# Altium schematic sheet POWER_ADC.SchDoc: ADC Supply
size A3; SheetNumber: 8; SheetTotal: 17
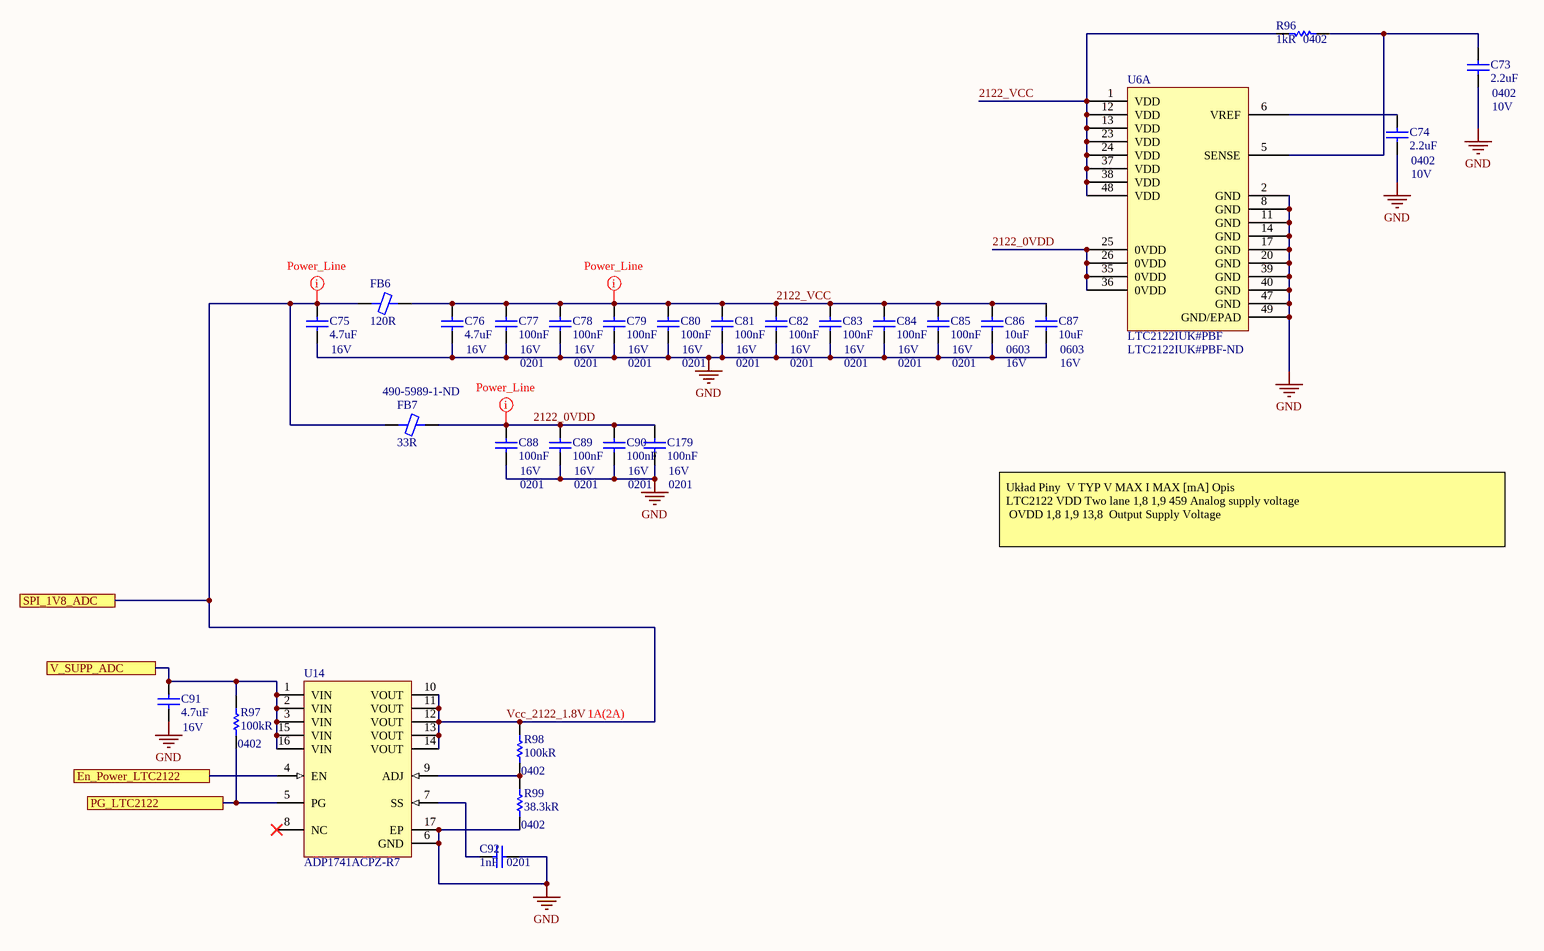
[diagram p0: POWER_ADC.SchDoc]

## Parts
C73  2.2uF  Case Code (Imperial): 0402  Voltage Rating: 10V  [CAP 0402/1005 RF KK]
C74  2.2uF  Case Code (Imperial): 0402  Voltage Rating: 10V  [CAP 0402/1005 RF KK]
C75  4.7uF  Voltage: 16V  [CAP 0603/1608 RF]
C76  4.7uF  Voltage: 16V  [CAP 0603/1608 RF]
C77  100nF  Case/Package: 0201  Voltage Rating: 16V  [CAP 0201/0603 KK]
C78  100nF  Case/Package: 0201  Voltage Rating: 16V  [CAP 0201/0603 KK]
C79  100nF  Case/Package: 0201  Voltage Rating: 16V  [CAP 0201/0603 KK]
C80  100nF  Case/Package: 0201  Voltage Rating: 16V  [CAP 0201/0603 KK]
C81  100nF  Case/Package: 0201  Voltage Rating: 16V  [CAP 0201/0603 KK]
C82  100nF  Case/Package: 0201  Voltage Rating: 16V  [CAP 0201/0603 KK]
C83  100nF  Case/Package: 0201  Voltage Rating: 16V  [CAP 0201/0603 KK]
C84  100nF  Case/Package: 0201  Voltage Rating: 16V  [CAP 0201/0603 KK]
C85  100nF  Case/Package: 0201  Voltage Rating: 16V  [CAP 0201/0603 KK]
C86  10uF  Case/Package: 0603  Voltage Rating: 16V  [CAP 0603/1608 RF]
C87  10uF  Case/Package: 0603  Voltage Rating: 16V  [CAP 0603/1608 RF]
C88  100nF  Case/Package: 0201  Voltage Rating: 16V  [CAP 0201/0603 KK]
C89  100nF  Case/Package: 0201  Voltage Rating: 16V  [CAP 0201/0603 KK]
C90  100nF  Case/Package: 0201  Voltage Rating: 16V  [CAP 0201/0603 KK]
C91  4.7uF  Voltage: 16V  [CAP 0603/1608 RF]
C92  1nF  Case/Package: 0201  [CAP 0201/0603 KK]
C179  100nF  Case/Package: 0201  Voltage Rating: 16V  [CAP 0201/0603 KK]
FB6  120R  [FER 0402/1005 KK]
FB7  33R  Supplier Part Number 1: 490-5989-1-ND  [FB1206]
R96  1kR  Case/Package: 0402  [RES 0402/1005 RF KK]
R97  100kR  Case/Package: 0402  [RES 0402/1005 RF KK]
R98  100kR  Case/Package: 0402  [RES 0402/1005 RF KK]
R99  38.3kR  Case/Package: 0402  [RES 0402/1005 RF KK]
U6  LTC2122IUK#PBF  Supplier Part Number 1: LTC2122IUK#PBF-ND  [LTC2122]  (part A of 2)
U14  ADP1741ACPZ-R7  [ADI-CP-16-13_M]

## Ports
En_Power_LTC2122, PG_LTC2122, SPI_1V8_ADC, V_SUPP_ADC

## Nets
GND: C73.1 C74.1 C75.1 C76.1 C77.1 C78.1 C79.1 C80.1 C81.1 C82.1 C83.1 C84.1 C85.1 C86.1 C87.1 C88.1 C89.1 C90.1 C91.1 C92.2 C179.1 R99.1 U6.2(GND) U6.8(GND) U6.11(GND) U6.14(GND) U6.17(GND) U6.20(GND) U6.39(GND) U6.40(GND) U6.47(GND) U6.49(GND/EPAD) U14.6(GND) U14.17(EP)
2122_0VDD: C88.2 C89.2 C90.2 C179.2 FB7.2 U6.25(0VDD) U6.26(0VDD) U6.35(0VDD) U6.36(0VDD)
2122_VCC: C76.2 C77.2 C78.2 C79.2 C80.2 C81.2 C82.2 C83.2 C84.2 C85.2 C86.2 C87.2 FB6.2 R96.1 U6.1(VDD) U6.12(VDD) U6.13(VDD) U6.23(VDD) U6.24(VDD) U6.37(VDD) U6.38(VDD) U6.48(VDD)
En_Power_LTC2122: U14.4(EN) ; port En_Power_LTC2122
PG_LTC2122: R97.1 U14.5(PG) ; port PG_LTC2122
V_SUPP_ADC: C91.2 R97.2 U14.1(VIN) U14.2(VIN) U14.3(VIN) U14.15(VIN) U14.16(VIN) ; port V_SUPP_ADC
Vcc_2122_1.8V: C75.2 FB6.1 FB7.1 R98.2 U14.10(VOUT) U14.11(VOUT) U14.12(VOUT) U14.13(VOUT) U14.14(VOUT) ; port SPI_1V8_ADC
NetC73_2: C73.2 R96.2 U6.5(SENSE)
NetC74_2: C74.2 U6.6(VREF)
NetC92_1: C92.1 U14.7(SS)
NetR98_1: R98.1 R99.2 U14.9(ADJ)

Not connected (* = marked no-connect by the designer): U14 8(NC)*

## Layout directives
net class Power_Line: 2122_0VDD, 2122_VCC, Vcc_2122_1.8V

## Notes on the sheet
- Układ	Piny 	V TYP	V MAX	I MAX [mA]	Opis
  LTC2122	VDD Two lane	1,8	1,9	459	Analog supply voltage
  OVDD	1,8	1,9	13,8		Output Supply Voltage
- 1A(2A)
- Title
- Size:
- Date:
- A3
- Number:
- Time:
- Revision:
- Sheet
- of
- File:

## Library data of the parts
C73 C74 = Capacitor: MURATA - GRM155R61A225KE95D - Keramikvielschichtkondensator, SMD, 2.2 µF, 10 V, 0402 [Metrisch 1005], ± 10%, X5R, Baureihe GRM; Material: Ceramic; Supplier 1: Digi-Key; Supplier Part Number 1: 490-10451-1-ND; Manufacturer: Murata; Manufacturer Part Number: GRM155R61A225KE95D; RoHS: Yes; Category: Ceramic Capacitors; Stock 1: 2215146; Pricing 1: 1=0,11000, 10=0,08100, 100=0,03800, 500=0,02664, 1000=0,02205, 2500=0,02052, 5000=0,01878 (USD); Mount: Surface Mount; Case/Package: 0402; Weight: 0.000212oz; Case Code (Metric): 1005; Min Operating Temperature: -55°C; Max Operating Temperature: 85°C; Dielectric: X5R; Termination: SMD/SMT; Voltage Rating (DC): 10V; Package Quantity: 10000; Capacitance: 2.2uF; Tolerance: 10%; Packaging: Tape and Reel; Length: 1mm; Height: 0.5mm; Thickness: 0.022inch; Depth: 0.5mm; Width: 0.5mm; REACH SVHC: No SVHC; Lead Free: Lead Free; ComponentLink1URL: http://www.mouser.com/ds/2/281/c02e-2905.pdf?src-supplier=Mouser; ComponentLink1Description: http://www.mouser.com/ds/2/281/c02e-2905.pdf?src-supplier=Mouser; ComponentLink2URL: http://components.arrow.com/part/dataview/0323_04264073?src-supplier=Arrow+Europe; ComponentLink2Description: http://components.arrow.com/part/dataview/0323_04264073?src-supplier=Arrow+Europe; ComponentLink3URL: http://www.farnell.com/datasheets/1872202.pdf?src-supplier=Farnell; ComponentLink3Description: http://www.farnell.com/datasheets/1872202.pdf?src-supplier=Farnell; ComponentLink4URL: http://www.farnell.com/datasheets/2047915.pdf?src-supplier=Farnell; ComponentLink4Description: http://www.farnell.com/datasheets/2047915.pdf?src-supplier=Farnell; ComponentLink5URL: http://www.farnell.com/datasheets/1872202.pdf?src-supplier=Element14; ComponentLink5Description: http://www.farnell.com/datasheets/1872202.pdf?src-supplier=Element14; ComponentLink6URL: http://www.farnell.com/datasheets/1872202.pdf?src-supplier=Newark; ComponentLink6Description: http://www.farnell.com/datasheets/1872202.pdf?src-supplier=Newark; ComponentLink7URL: http://psearch.en.murata.com/capacitor/product/GRM155R61A225KE95%23.pdf?src-supplier=Avnet; ComponentLink7Description: http://psearch.en.murata.com/capacitor/product/GRM155R61A225KE95%23.pdf?src-supplier=Avnet; ComponentLink8URL: http://www.farnell.com/datasheets/2047915.pdf?src-supplier=Element14; ComponentLink8Description: http://www.farnell.com/datasheets/2047915.pdf?src-supplier=Element14; ComponentLink9URL: https://search.murata.co.jp/Ceramy/image/img/A01X/G101/ENG/GRM155R61A225KE95-01.pdf?src-supplier=Digi-Key; ComponentLink9Description: https://search.murata.co.jp/Ceramy/image/img/A01X/G101/ENG/GRM155R61A225KE95-01.pdf?src-supplier=Digi-Key; ComponentLink10URL: http://www.farnell.com/datasheets/2047915.pdf?src-supplier=Newark; ComponentLink10Description: http://www.farnell.com/datasheets/2047915.pdf?src-supplier=Newark
C75 C76 C91 = Capacitor: TAIYO YUDEN - EMK107ABJ475MA-T - SMD Multilayer Ceramic Capacitor, 4.7 µF, 16 V, 0603 [1608 Metric], ± 20%, X5R, M Series; Supplier 1: Digi-Key; Supplier Part Number 1: 587-6003-1-ND; Manufacturer: Taiyo Yuden; Manufacturer Part Number: EMK107ABJ475MA-T; RoHS: Yes; Category: Ceramic Capacitors; Stock 1: 5; Pricing 1: 1=0,28000, 10=0,19200, 50=0,12820, 100=0,10900, 500=0,07696, 1000=0,06734 (USD); Mount: Surface Mount; Case/Package: Ceramic; Min Operating Temperature: -55°C; Max Operating Temperature: 85°C; Capacitance: 4.7uF; Tolerance: 20%; Packaging: Tape and Reel; Dielectric: X5R; Length: 1.6mm; Height: 0.8mm; Depth: 0.8mm; Radiation Hardening: No; Lead Free: Lead Free; ComponentLink1URL: https://datasheet.ciiva.com/26871/getdatasheetpartid-637315-26871304.pdf?src-supplier=Verical; ComponentLink1Description: https://datasheet.ciiva.com/26871/getdatasheetpartid-637315-26871304.pdf?src-supplier=Verical
C77-C85 C88-C90 C179 = Capacitor: Manufacturer 1: Murata; Manufacturer Part Number 1: GRM033R61C104ME84D; Tolerance: 20%; Dielectric: X5R; Supplier 1: Digi-Key; Supplier Part Number 1: 490-9986-1-ND; Stock 1: 503570; Pricing 1: 1=0.10000, 10=0.05400, 100=0.02430, 500=0.01732, 1000=0.01361, 2500=0.01238, 5000=0.01139 (USD); RoHS: Yes; Mount: Surface Mount; Weight: 1.2E-05oz; Case Code (Metric): 0603; Case Code (Imperial): 0201; Min Operating Temperature: -55°C; Max Operating Temperature: 85°C; Capacitance: 100nF; Packaging: Tape and Reel; Termination: SMD/SMT; Voltage Rating (DC): 16V; Package Quantity: 15000; Length: 0.024inch; Height: 0.3mm; Width: 0.3mm; Thickness: 0.013inch; ComponentLink1URL: http://www.mouser.com/ds/2/281/c02e-2905.pdf?src-supplier=Mouser; ComponentLink1Description: http://www.mouser.com/ds/2/281/c02e-2905.pdf?src-supplier=Mouser; ComponentLink2URL: http://search.murata.co.jp/Ceramy/image/img/A01X/G101/ENG/GRM033R61C104ME84-01.pdf?src-supplier=Digi-Key; ComponentLink2Description: http://search.murata.co.jp/Ceramy/image/img/A01X/G101/ENG/GRM033R61C104ME84-01.pdf?src-supplier=Digi-Key
C86 C87 = Capacitor: 0603 10 uF 16 V ±10% Tolerance X5R Multilayer Ceramic Capacitor; Manufacturer: Murata; Manufacturer Part Number: GRM188R61C106KAALJ; Supplier 1: Digi-Key; Supplier Part Number 1: 490-12736-1-ND; RoHS: Yes; Category: Ceramic Capacitors; Stock 1: 68393; Pricing 1: 1=0,43000, 10=0,29900, 100=0,17910, 500=0,13434, 1000=0,11345, 2500=0,10748, 5000=0,10150 (USD); Mount: Surface Mount; Weight: 0.000222oz; Case Code (Imperial): 0603; Case Code (Metric): 1608; Min Operating Temperature: -55°C; Max Operating Temperature: 85°C; Tolerance: 10%; Packaging: Tape and Reel; Capacitance: 10uF; Dielectric: X5R; Termination: SMD/SMT; Composition: Ceramic; Voltage Rating (DC): 16V; Package Quantity: 10000; Length: 0.063inch; Height: 0.8mm; Width: 0.031inch; Thickness: 0.037inch; ComponentLink1URL: http://www.mouser.com/ds/2/281/GRM188R61C106KAAL-01-1064790.pdf?src-supplier=Mouser; ComponentLink1Description: http://www.mouser.com/ds/2/281/GRM188R61C106KAAL-01-1064790.pdf?src-supplier=Mouser; ComponentLink2URL: http://search.murata.co.jp/Ceramy/image/img/A01X/G101/ENG/GRM188R61C106KAAL-01.pdf?src-supplier=Digi-Key; ComponentLink2Description: http://search.murata.co.jp/Ceramy/image/img/A01X/G101/ENG/GRM188R61C106KAAL-01.pdf?src-supplier=Digi-Key
C92 = Capacitor: Cap Ceramic 0.001uF 25V X7R 10% SMD 0201 125°C Paper T/R; Manufacturer: Murata; Manufacturer Part Number: GRM033R71E102KA01J; Supplier 1: Digi-Key; Supplier Part Number 1: 490-8161-1-ND; RoHS: Yes; Category: Ceramic Capacitors; Stock 1: 140332; Pricing 1: 1=0,10000, 10=0,02900, 100=0,01300, 500=0,00932, 1000=0,00732, 2500=0,00666, 5000=0,00612 (USD); Mount: Surface Mount; Case Code (Metric): 0603; Case Code (Imperial): 0201; Min Operating Temperature: -55°C; Max Operating Temperature: 125°C; Package Quantity: 50000; Packaging: Tape and Reel; Capacitance: 1nF; Tolerance: 10%; Voltage Rating: 25V; Voltage Rating (DC): 25V; Termination: SMD/SMT; Dielectric: X7R; Length: 0.6mm; Height: 0.3mm; Width: 0.012inch; Thickness: 0.013inch; Depth: 0.3mm; Radiation Hardening: No; ComponentLink1URL: https://datasheet.ciiva.com/5453/product-5453157.pdf?src-supplier=Mouser; ComponentLink1Description: https://datasheet.ciiva.com/5453/product-5453157.pdf?src-supplier=Mouser; ComponentLink2URL: https://datasheet.ciiva.com/11621/product-11621675.pdf?src-supplier=Avnet; ComponentLink2Description: https://datasheet.ciiva.com/11621/product-11621675.pdf?src-supplier=Avnet
FB6 = Ferrite: FERRITE BEAD 120 OHM 0402 1LN; Manufacturer: Murata; Manufacturer Part Number: BLM15BB121SN1D; Material: Ferrite,Steel; Tolerance: 25%; Current Rating: 300mA; DC Resistance (DCR): 550mR; Test Frequency: 100MHz; Shielding: Unshielded; Number of Lines: 1; Supplier 1: Digi-Key; Supplier Part Number 1: 490-1008-1-ND; RoHS: Yes; Category: Inductors; Stock 1: 72662; Pricing 1: 1=0,10000, 10=0,08300, 25=0,07440, 50=0,05440, 100=0,04700, 250=0,03712, 500=0,03136, 1000=0,02640, 5000=0,02351 (USD); Case/Package: 0402; Number of Pins: 2; Case Code (Metric): 1005; Case Code (Imperial): 0402; Core Material: Ferrite; Min Operating Temperature: -55°C; Max Operating Temperature: 125°C; Package Quantity: 1; Packaging: Tape and Reel; Max DC Current: 300mA; Termination: SMD/SMT; Frequency: 100MHz; Resistor Type: Ferrite Bead; Impedance: 120R; Max Current Rating: 300mA; Number of Circuits: 1; Length: 1mm; Height: 0.5mm; Width: 0.5mm; Depth: 0.5mm; Lead Free: Lead Free; REACH SVHC: No SVHC; ComponentLink1URL: https://datasheet.ciiva.com/1466/5145-1466832.pdf?src-supplier=Element14; ComponentLink1Description: https://datasheet.ciiva.com/1466/5145-1466832.pdf?src-supplier=Element14; ComponentLink2URL: https://datasheet.ciiva.com/41449/001172179-da-01-en-drossel-0402-120r-1-0x0-5mm-10000st-41449466.pdf?src-supplier=Conrad; ComponentLink2Description: https://datasheet.ciiva.com/41449/001172179-da-01-en-drossel-0402-120r-1-0x0-5mm-10000st-41449466.pdf?src-supplier=Conrad; ComponentLink3URL: https://datasheet.ciiva.com/1466/5145-1466833.pdf?src-supplier=Element14; ComponentLink3Description: https://datasheet.ciiva.com/1466/5145-1466833.pdf?src-supplier=Element14; ComponentLink4URL: https://datasheet.ciiva.com/3082/l0110s0100blm15b-3082680.pdf?src-supplier=Avnet; ComponentLink4Description: https://datasheet.ciiva.com/3082/l0110s0100blm15b-3082680.pdf?src-supplier=Avnet; ComponentLink5URL: https://datasheet.ciiva.com/16213/l0110s0100blm15b-16213674.pdf?src-supplier=Future+Electronics; ComponentLink5Description: https://datasheet.ciiva.com/16213/l0110s0100blm15b-16213674.pdf?src-supplier=Future+Electronics; ComponentLink6URL: https://datasheet.ciiva.com/1012/l0110s0100blm15b-1012029.pdf?src-supplier=Digi-Key; ComponentLink6Description: https://datasheet.ciiva.com/1012/l0110s0100blm15b-1012029.pdf?src-supplier=Digi-Key; ComponentLink7URL: https://datasheet.ciiva.com/1012/l0110s0100blm15b-1012030.pdf?src-supplier=Digi-Key; ComponentLink7Description: https://datasheet.ciiva.com/1012/l0110s0100blm15b-1012030.pdf?src-supplier=Digi-Key; ComponentLink8URL: https://datasheet.ciiva.com/1012/l0110s0100blm15b-1012031.pdf?src-supplier=Digi-Key; ComponentLink8Description: https://datasheet.ciiva.com/1012/l0110s0100blm15b-1012031.pdf?src-supplier=Digi-Key
FB7 = Ferrite: MURATA - BLM31PG330SN1L - Koralik ferrytowy, 1206 [jedn. metryczne: 3216], 33 ohm, 6 A, EMIFIL BLM31P Series, 0.009 ohm; Material: Steel,Ferrite; Tolerance: 25%; Number of Lines: 1; Max Current Rating: 6A; DC Resistance (DCR): 9mR; Test Frequency: 100MHz; Shielding: Unshielded; Supplier 1: Digi-Key; Manufacturer: Murata; Manufacturer Part Number: BLM31PG330SN1L; RoHS: Yes; Category: Ferrite Beads and Chips; Stock 1: 56200; Pricing 1: 1=0,31000, 10=0,24100, 25=0,19920, 50=0,17180, 100=0,15470, 250=0,13064, 500=0,11688, 1000=0,09969 (USD); Case/Package: 1206; Number of Pins: 2; Case Code (Metric): 3216; Case Code (Imperial): 1206; Contact Plating: Tin,Matte; Min Operating Temperature: -55°C; Max Operating Temperature: 125°C; Impedance: 33R; Package Quantity: 1; Packaging: Tape and Reel; Current Rating: 6A; Max DC Current: 6A; Termination: Flat; Length: 3.2mm; Height: 1.1mm; Width: 1.6mm; Depth: 1.6mm; Lead Free: Lead Free; ComponentLink1URL: https://datasheet.ciiva.com/11799/0900766b811b5866-11799415.pdf?src-supplier=RSComponents; ComponentLink1Description: https://datasheet.ciiva.com/11799/0900766b811b5866-11799415.pdf?src-supplier=RSComponents; ComponentLink2URL: https://datasheet.ciiva.com/41449/001172384-da-01-en-drossel-1206-33r0-3-2x1-60mm-3000st-41449553.pdf?src-supplier=Conrad; ComponentLink2Description: https://datasheet.ciiva.com/41449/001172384-da-01-en-drossel-1206-33r0-3-2x1-60mm-3000st-41449553.pdf?src-supplier=Conrad; ComponentLink3URL: https://datasheet.ciiva.com/41449/001171745-da-01-en-chip-drossel1206-33r0-6000ma-3-2x1-60mm-41449400.pdf?src-supplier=Conrad; ComponentLink3Description: https://datasheet.ciiva.com/41449/001171745-da-01-en-chip-drossel1206-33r0-6000ma-3-2x1-60mm-41449400.pdf?src-supplier=Conrad; ComponentLink4URL: https://datasheet.ciiva.com/6211/l0110s0100blm31p-6211896.pdf?src-supplier=Digi-Key; ComponentLink4Description: https://datasheet.ciiva.com/6211/l0110s0100blm31p-6211896.pdf?src-supplier=Digi-Key; ComponentLink5URL: https://datasheet.ciiva.com/14122/apblm31p-data-e-14122216.pdf?src-supplier=Distrelec; ComponentLink5Description: https://datasheet.ciiva.com/14122/apblm31p-data-e-14122216.pdf?src-supplier=Distrelec; ComponentLink6URL: https://datasheet.ciiva.com/6211/l0110s0100blm31p-6211899.pdf?src-supplier=Digi-Key; ComponentLink6Description: https://datasheet.ciiva.com/6211/l0110s0100blm31p-6211899.pdf?src-supplier=Digi-Key; ComponentLink7URL: https://datasheet.ciiva.com/16205/l0110s0100blm31p-16205563.pdf?src-supplier=Future+Electronics; ComponentLink7Description: https://datasheet.ciiva.com/16205/l0110s0100blm31p-16205563.pdf?src-supplier=Future+Electronics; ComponentLink8URL: https://datasheet.ciiva.com/6211/l0110s0100blm31p-6211900.pdf?src-supplier=Digi-Key; ComponentLink8Description: https://datasheet.ciiva.com/6211/l0110s0100blm31p-6211900.pdf?src-supplier=Digi-Key; ComponentLink9URL: https://datasheet.ciiva.com/3067/c31e-3067133.pdf?src-supplier=Avnet; ComponentLink9Description: https://datasheet.ciiva.com/3067/c31e-3067133.pdf?src-supplier=Avnet; ComponentLink10URL: https://datasheet.ciiva.com/3067/c31e-3067134.pdf?src-supplier=Avnet; ComponentLink10Description: https://datasheet.ciiva.com/3067/c31e-3067134.pdf?src-supplier=Avnet; ComponentLink11URL: https://datasheet.ciiva.com/16552/c31e-16552158.pdf?src-supplier=Avnet+Europe; ComponentLink11Description: https://datasheet.ciiva.com/16552/c31e-16552158.pdf?src-supplier=Avnet+Europe
R96 = Resistor: Manufacturer 1: Yageo; Manufacturer Part Number 1: RC0402FR-071KL; Tolerance: 1%; Temperature Coefficient: 100ppm/°C; Power Rating: 62.5mW; Voltage Rating: 50V; Supplier 1: Digi-Key; Supplier Part Number 1: 311-1.00KLRCT-ND; Stock 1: 57541929; Pricing 1: 1=0,10000, 10=0,01600, 100=0,00640, 1000=0,00289, 2500=0,00251, 5000=0,00207 (USD); RoHS: Yes; Number of Pins: 2; Case Code (Imperial): 0402; Case Code (Metric): 1005; Min Operating Temperature: -55°C; Max Operating Temperature: 155°C; Packaging: Tape and Reel; Resistance: 1kR; Composition: Thick Film; Voltage Rating (DC): 50V; Termination: SMD/SMT; Military Standard: Not; Length: 1mm; Height: 0.32mm; Width: 0.5mm; Depth: 0.5mm; REACH SVHC: Unknown; Lead Free: Lead Free; ComponentLink1URL: https://datasheet.ciiva.com/11819/0900766b80c66297-11819477.pdf?src-supplier=RSComponents; ComponentLink1Description: https://datasheet.ciiva.com/11819/0900766b80c66297-11819477.pdf?src-supplier=RSComponents; ComponentLink2URL: https://datasheet.ciiva.com/12666/pyu-rc0402-51-rohs-l-6-r-12666741.pdf?src-supplier=Mouser; ComponentLink2Description: https://datasheet.ciiva.com/12666/pyu-rc0402-51-rohs-l-6-r-12666741.pdf?src-supplier=Mouser; ComponentLink3URL: https://datasheet.ciiva.com/17063/pyu-rc0402-51-rohs-l-6-r-17063193.pdf?src-supplier=Future+Electronics; ComponentLink3Description: https://datasheet.ciiva.com/17063/pyu-rc0402-51-rohs-l-6-r-17063193.pdf?src-supplier=Future+Electronics; ComponentLink4URL: https://datasheet.ciiva.com/22747/1018594-22747513.pdf?src-supplier=Element14; ComponentLink4Description: https://datasheet.ciiva.com/22747/1018594-22747513.pdf?src-supplier=Element14; ComponentLink5URL: https://datasheet.ciiva.com/7849/1018594-7849869.pdf?src-supplier=Element14; ComponentLink5Description: https://datasheet.ciiva.com/7849/1018594-7849869.pdf?src-supplier=Element14; ComponentLink6URL: https://datasheet.ciiva.com/7983/1018594-7983502.pdf?src-supplier=Element14; ComponentLink6Description: https://datasheet.ciiva.com/7983/1018594-7983502.pdf?src-supplier=Element14; ComponentLink7URL: https://datasheet.ciiva.com/7849/1018594-7849871.pdf?src-supplier=Element14; ComponentLink7Description: https://datasheet.ciiva.com/7849/1018594-7849871.pdf?src-supplier=Element14
R97 R98 = Resistor: Manufacturer 1: Yageo; Manufacturer Part Number 1: RC0402FR-07100KL; Power Rating: 63mW; Tolerance: 1%; Voltage Rating: 50V; Temperature Coefficient: 100ppm/°C; Supplier 1: Digi-Key; Supplier Part Number 1: 311-100KLRCT-ND; Stock 1: 51358973; Pricing 1: 1=0,10000, 10=0,01500, 100=0,00600, 1000=0,00270, 2500=0,00235, 5000=0,00194 (USD); RoHS: Yes; Case Code (Metric): 1005; Case Code (Imperial): 0402; Min Operating Temperature: -55°C; Max Operating Temperature: 155°C; Resistance: 100kR; Packaging: Tape and Reel; Composition: Thick Film; Termination: SMD/SMT; Military Standard: Not; Number of Terminations: 2; Working Voltage: 50V; Package Quantity: 1; Max Power Dissipation: 63mW; Features: Moisture Resistant; Length: 0.039inch; Height: 0.016inch; Width: 0.02inch; Depth: 0.5mm; REACH SVHC: No SVHC; Lead Free: Lead Free; ComponentLink1URL: https://datasheet.ciiva.com/11819/0900766b80c66297-11819452.pdf?src-supplier=RSComponents; ComponentLink1Description: https://datasheet.ciiva.com/11819/0900766b80c66297-11819452.pdf?src-supplier=RSComponents; ComponentLink2URL: https://datasheet.ciiva.com/2453/pyu-r-int-thick-7-2453361.pdf?src-supplier=Digi-Key; ComponentLink2Description: https://datasheet.ciiva.com/2453/pyu-r-int-thick-7-2453361.pdf?src-supplier=Digi-Key; ComponentLink3URL: https://datasheet.ciiva.com/2453/pyu-r-int-thick-7-2453362.pdf?src-supplier=Digi-Key; ComponentLink3Description: https://datasheet.ciiva.com/2453/pyu-r-int-thick-7-2453362.pdf?src-supplier=Digi-Key; ComponentLink4URL: https://datasheet.ciiva.com/2453/pyu-r-int-thick-7-2453363.pdf?src-supplier=Digi-Key; ComponentLink4Description: https://datasheet.ciiva.com/2453/pyu-r-int-thick-7-2453363.pdf?src-supplier=Digi-Key; ComponentLink5URL: https://datasheet.ciiva.com/22747/1018594-22747509.pdf?src-supplier=Element14; ComponentLink5Description: https://datasheet.ciiva.com/22747/1018594-22747509.pdf?src-supplier=Element14; ComponentLink6URL: https://datasheet.ciiva.com/15189/getdatasheetpartid-323696-15189334.pdf?src-supplier=Verical; ComponentLink6Description: https://datasheet.ciiva.com/15189/getdatasheetpartid-323696-15189334.pdf?src-supplier=Verical; ComponentLink7URL: https://datasheet.ciiva.com/12667/pyu-rc0402-51-rohs-l-6-r-12667930.pdf?src-supplier=Mouser; ComponentLink7Description: https://datasheet.ciiva.com/12667/pyu-rc0402-51-rohs-l-6-r-12667930.pdf?src-supplier=Mouser
R99 = Resistor: RT Series 0402 0.063 W 38.3 kOhms 0.5% ±50 ppm/°C SMT Thin Film Chip Resistor; Manufacturer: Yageo; Manufacturer Part Number: RT0402DRE0738K3L; Voltage Rating (DC): 50V; Power Rating: 63mW; Supplier 1: Digi-Key; Supplier Part Number 1: 311-2278-1-ND; RoHS: Yes; Category: Chip SMD Resistors; Stock 1: 29268; Pricing 1: 1=0,20000, 10=0,16800, 100=0,06570, 1000=0,02750, 2500=0,02521, 5000=0,02292 (USD); Case Code (Metric): 1005; Case Code (Imperial): 0402; Min Operating Temperature: -55°C; Max Operating Temperature: 155°C; Features: Moisture Resistant; Resistance: 38.3kR; Tolerance: 0.5%; Packaging: Tape and Reel; Composition: Thin Film; Number of Terminations: 2; Max Power Dissipation: 63mW; Temperature Coefficient: 50ppm/°C; Length: 0.039inch; Height: 0.014inch; Width: 0.02inch; Lead Free: Lead Free; ComponentLink1URL: http://www.yageo.com/documents/recent/PYu-RT_1-to-0.01_RoHS_L_9.pdf?src-supplier=Digi-Key; ComponentLink1Description: http://www.yageo.com/documents/recent/PYu-RT_1-to-0.01_RoHS_L_9.pdf?src-supplier=Digi-Key; ComponentLink2URL: http://www.yageo.com/documents/recent/PYu-RT_1-to-0.05_RoHS_L_(4).pdf?src-supplier=Future+Electronics; ComponentLink2Description: http://www.yageo.com/documents/recent/PYu-RT_1-to-0.05_RoHS_L_(4).pdf?src-supplier=Future+Electronics
U6 = LTC2122IUK#PBF: IC ADC 14BIT 170MSPS 48QFN; Manufacturer: Analog Devices / Linear Technology; Number of Bits: 14; Sampling Rate: 170000000S/s; Number of Inputs: 2; Min Supply Voltage: 1.7V; Max Supply Voltage: 1.9V; Interface: SPI; Resolution: 14b; Supplier 1: Digi-Key; Manufacturer Part Number: LTC2122IUK#PBF; RoHS: Yes; Category: Analog to Digital Converters (ADCs); Stock 1: 52; Pricing 1: 1=105,29000, 25=102,14040 (USD); Case/Package: QFN; Number of Pins: 48; Min Operating Temperature: -40°C; Max Operating Temperature: 85°C; Packaging: Tray; Number of A/D Converters: 2; REACH SVHC: No SVHC; ComponentLink1URL: http://www.linear.com/docs/45350?src-supplier=Digi-Key; ComponentLink1Description: http://www.linear.com/docs/45350?src-supplier=Digi-Key; ComponentLink2URL: http://www.farnell.com/datasheets/1968213.pdf?src-supplier=Element14; ComponentLink2Description: http://www.farnell.com/datasheets/1968213.pdf?src-supplier=Element14
U14 = ADP1741ACPZ-R7: 2 A, Low VIN, Low Dropout Linear Regulator, 1.6 to 3.6 V Vin, 0.75 to 3 V Vout, Industrial, 16-pin QFN (CP-16-13), Reel; Manufacturer: Analog Devices; Iout max: 2A; Supply Current IGND @ Small Load: 90uA; Vin (max) (V): 3.6; Vin (min) (V): 1.6; Vout Adjustable Range: 0.75V to 3.3V; DatasheetVersion: Rev. D; PackageVersion: 031006-A, 06/2006; PackageReference: CP-16-13; PackageDescription: 16-Pin Lead Frame Chip Scale Package, Body 4 x 4 mm, Pitch 0.65 mm; Supplier 1: Digi-Key; Supplier Part Number 1: ADP1741ACPZ-R7TR-ND; Supplier 2: Digi-Key; Supplier Part Number 2: ADP1741ACPZ-R7CT-ND; Supplier 3: Digi-Key; Supplier Part Number 3: ADP1741ACPZ-R7DKR-ND; Supplier 4: Newark; Supplier Part Number 4: 72W4083; Supplier 5: Newark; Supplier Part Number 5: 34P3050; Supplier 6: Mouser; Supplier Part Number 6: 584-ADP1741ACPZ-R7; Packing: Reel; Mounting Technology: Surface Mount; Code_JEDEC: MO-220-VGGC.; PartNumber: ADP1741ACPZ-R7; ComponentLink1Description: Manufacturer URL; ComponentLink1URL: http://www.analog.com/en/index.html; ComponentLink2Description: Datasheet; ComponentLink2URL: http://www.analog.com/static/imported-files/data_sheets/ADP1740_1741.pdf; ComponentLink3Description: Package Specification; ComponentLink3URL: http://www.analog.com/static/imported-files/packages/PKG_PDF/LFCSP(CP)/CP-16/CP_16_13.pdf; ComponentLink4Description: URL Link1; ComponentLink4URL: Product URL:http://www.analog.com/en/ADP1741/productSearch.html